# Altium schematic sheet Headphones_Sec.SchDoc
size A4; DocumentNumber: 9; SheetNumber: 9; SheetTotal: 28
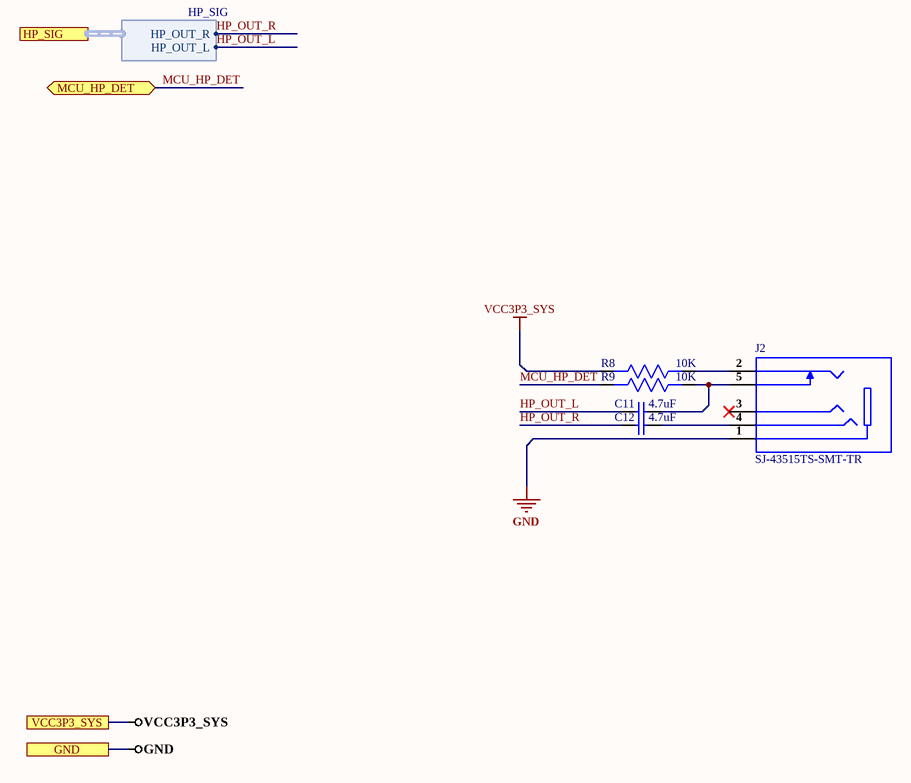
[diagram p0: Headphones_Sec.SchDoc]

## Parts
C11  4.7uF  [Cap0603]
C12  4.7uF  [Cap0603]
J2  SJ-43515TS-SMT-TR  [SJ-43515TS-SMT-TR]
R8  10K  [Res0603]
R9  10K  [Res0603]

## Ports
GND, HP_SIG (harness HP_SIG), MCU_HP_DET (bidir), VCC3P3_SYS

## Harnesses
HP_SIG: HP_OUT_R, HP_OUT_L

## Nets
GND: J2.1 ; port GND
VCC3P3_SYS: R8.2 ; port VCC3P3_SYS
HP_OUT_L: C11.1 ; port HP_SIG.HP_OUT_L
HP_OUT_R: C12.1 ; port HP_SIG.HP_OUT_R
MCU_HP_DET: R9.2 ; port MCU_HP_DET
NetC11_2: C11.2 J2.5 R9.1
NetC12_2: C12.2 J2.4
NetJ2_2: J2.2 R8.1

Not connected (* = marked no-connect by the designer): J2 3*

## Library data of the parts
C11 C12 = C1608X5R1E475M080AC: CAP CER 4.7UF 25V X5R 0603; Manufacturer: TDK; Dielectric Material: Ceramic; Tolerance: 20%; ComponentLink1URL: http://www.yageo.com/NewPortal/_en/search/productDocs.jsp?YageoPartNumber=AC0603JRNPO0BN470&src-supplier=Digi-Key; ComponentLink1Description: http://www.yageo.com/NewPortal/_en/search/productDocs.jsp?YageoPartNumber=AC0603JRNPO0BN470&src-supplier=Digi-Key; Supplier 1: Mouser; Manufacturer Part Number: C1608X5R1E475M080AC; Stock 1: 40236; Pricing 1: 1=0.29, 10=0.237, 100=0.142, 500=0.106, 1000=0.09, 4000=0.076, 8000=0.072, 24000=0.07, 48000=0.067 (USD); Mount: Surface Mount; Case/Package: 0603; Weight: 7.1E-05oz; Case Code (Metric): 1608; Case Code (Imperial): 0603; Min Operating Temperature: -55°C; Max Operating Temperature: 85°C; Voltage Rating (DC): 25V; Packaging: Tape and Reel; Package Quantity: 1; Capacitance: 4.7uF; Voltage Rating: 25V; Dielectric: X5R; Termination: SMD/SMT; Composition: Ceramic; Length: 1.6mm; Height: 0.8mm; Width: 0.031inch; Thickness: 0.039inch; Depth: 0.8mm; Radiation Hardening: No; REACH SVHC: No SVHC; Lead Free: Lead Free; ComponentLink2URL: https://www.verical.com/server-webapp/html/getDatasheet?partID=726745&src-supplier=Verical; ComponentLink2Description: https://www.verical.com/server-webapp/html/getDatasheet?partID=726745&src-supplier=Verical; Supplier Part Number 1: 810-C1608X5R1E475M
J2 = SJ-43515TS-SMT-TR: CONN JACK 4COND 3.5MM SMD R/A; Manufacturer: CUI; Body Color: Black; Current Rating: 1A; Gender: Female; Shielding: Unshielded; Number of Conductors: 4; Number of Ports: 1; Supplier 1: Digi-Key; Manufacturer Part Number: SJ-43515TS-SMT-TR; RoHS: Yes; Category: Connectors; Stock 1: 51087; Pricing 1: 1=1.07000, 10=0.90600, 25=0.86960, 50=0.85100, 100=0.81400, 250=0.74000, 500=0.66600 (USD); Mount: Surface Mount; Case/Package: SMD/SMT; Contact Plating: Silver; Color: Black; Packaging: Cut Tape; Termination: Solder; Connector Type: Jack; Orientation: Horizontal; Series: SJ; Lead Free: Lead Free; RoHS Compliant: Yes; ComponentLink1URL: https://datasheet.ciiva.com/7368/sj-4351x-smt-series-7368789.pdf?src-supplier=Digi-Key; ComponentLink1Description: https://datasheet.ciiva.com/7368/sj-4351x-smt-series-7368789.pdf?src-supplier=Digi-Key; ComponentLink2URL: https://datasheet.ciiva.com/7368/sj-4351x-smt-series-7368776.pdf?src-supplier=Digi-Key; ComponentLink2Description: https://datasheet.ciiva.com/7368/sj-4351x-smt-series-7368776.pdf?src-supplier=Digi-Key; ComponentLink3URL: https://datasheet.ciiva.com/16215/sj-4351x-smt-series-16215052.pdf?src-supplier=Future+Electronics; ComponentLink3Description: https://datasheet.ciiva.com/16215/sj-4351x-smt-series-16215052.pdf?src-supplier=Future+Electronics; Supplier Part Number 1: CP-43515TSSJCT-ND
R8 R9 = AC0603JR-0710KL: RES SMD 10K OHM 5% 1/10W 0603; Manufacturer: Yageo; Voltage Rating: 50V; Resistance: 10kR; Power Rating: 100mW; Temperature Coefficient: 100ppm/°C; Supplier 1: Future Electronics; Manufacturer Part Number: AC0603JR-0710KL; RoHS: Yes; Category: Chip SMD Resistors; Stock 1: 1533000; Pricing 1: 5000=0.00540 (USD); Case/Package: 0603; Case Code (Imperial): 0603; Case Code (Metric): 1608; Size Code: 0603; Min Operating Temperature: -55°C; Max Operating Temperature: 155°C; Packaging: Tape and Reel; Tolerance: 5%; Package Quantity: 1; Resistor Type: Thick Film; Termination: SMD/SMT; Number of Terminations: 2; Max Power Dissipation: 100mW; Features: Moisture Resistant,Automotive AEC-Q200,Anti-Sulfur; Series: AC; Construction: Rectangular; Length: 0.063inch; Width: 0.031inch; Height: 0.022inch; Depth: 0.8mm; Military Standard: Not; Lead Free: Lead Free; RoHS Compliant: Yes; ComponentLink1URL: https://datasheet.ciiva.com/5562/pyu-ac-51-rohs-l-2-5562553.pdf?src-supplier=Mouser; ComponentLink1Description: https://datasheet.ciiva.com/5562/pyu-ac-51-rohs-l-2-5562553.pdf?src-supplier=Mouser; Supplier Part Number 1: 1029044